# Altium project PCB_Project_2.PrjPcb
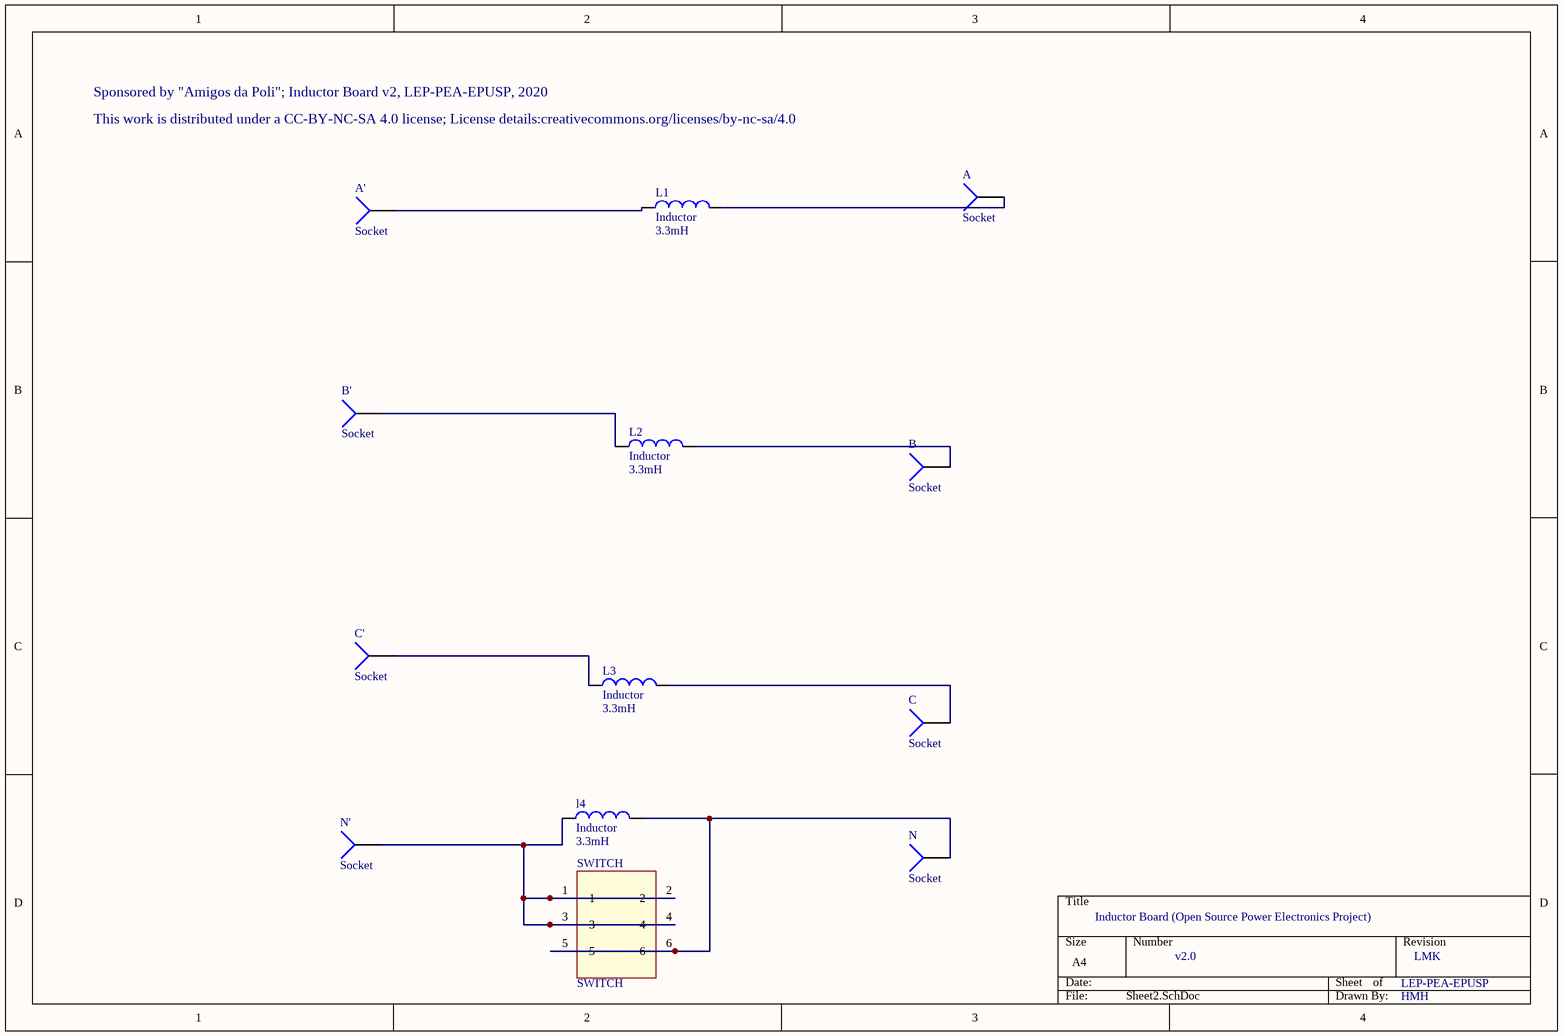
[diagram p0: Sheet2.SchDoc]
1 sheet, 13 parts. Net scope: global (net labels, ports and power ports of the same name join across sheets).
Board file: PCB2.PcbDoc

## Sheet Sheet2.SchDoc
size A4

### Parts
A  Socket  [PCBComponent_1]
A'  Socket  [PCBComponent_1]
B  Socket  [PCBComponent_1]
B'  Socket  [PCBComponent_1]
C  Socket  [PCBComponent_1]
C'  Socket  [PCBComponent_1]
L1  Inductor  value 3.3mH  [PCBComponent_1]
L2  Inductor  value 3.3mH  [PCBComponent_1]
L3  Inductor  value 3.3mH  [PCBComponent_1]
l4  Inductor  value 3.3mH  [PCBComponent_1]
N  Socket  [PCBComponent_1]
N'  Socket  [PCBComponent_1]
SWITCH  SWITCH  [PCBComponent_1]

### Nets
NetA'_1: A'.1 L1.1
NetA_1: A.1 L1.2
NetB'_1: B'.1 L2.1
NetB_1: B.1 L2.2
NetC'_1: C'.1 L3.1
NetC_1: C.1 L3.2
Netl4_1: l4.1 N'.1 SWITCH.1 SWITCH.2 SWITCH.3 SWITCH.4
Netl4_2: l4.2 N.1 SWITCH.5 SWITCH.6

### Notes on the sheet
- Sponsored by "Amigos da Poli"; Inductor Board v2, LEP-PEA-EPUSP, 2020
- This work is distributed under a CC-BY-NC-SA 4.0 license; License details:creativecommons.org/licenses/by-nc-sa/4.0
- Inductor Board (Open Source Power Electronics Project)
- v2.0
- LEP-PEA-EPUSP
- LMK
- HMH

### Library data of the parts
L1-L3 l4 = Inductor: Code_IEC: 1005; Published: 8-Jun-2000; LatestRevisionDate: 29-May-2009; LatestRevisionNote: IPC-7351 Footprint Added.; PackageReference: 0402-A; Publisher: Altium Limited; PackageDescription: Chip Inductor; Code_JEITA: 0402
SWITCH = CHAVE
A A' B B' C C' N N' = Socket: LatestRevisionDate: 17-Jul-2002; LatestRevisionNote: Re-released for DXP Platform.; Publisher: Altium Limited